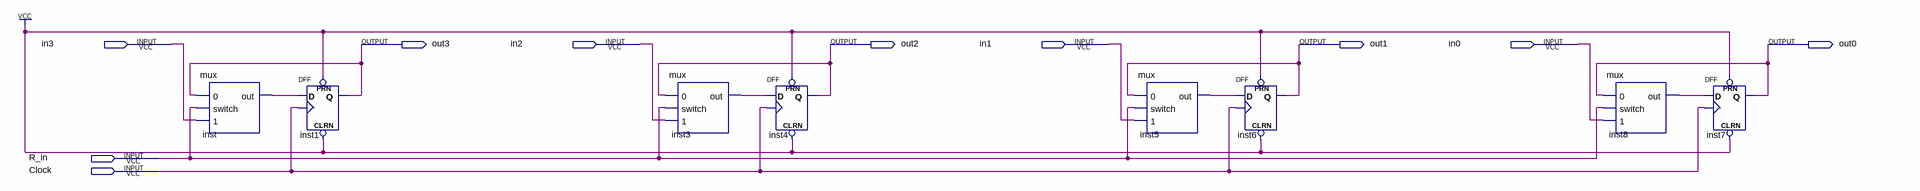
[diagram p0: schematic sheet]
// Quartus schematic register.bdf as structural Verilog: 8 symbols, 10 pins
module register (
  input  in3,
  input  in2,
  input  in1,
  input  in0,
  input  R_in,
  input  Clock,
  output out3,
  output out2,
  output out1,
  output out0
);

  wire inst3_out, inst5_out, inst8_out, inst_out;

  mux inst (.\0 (out3), .switch(R_in), .\1 (in3), .out(inst_out));
  DFF inst1 (.CLRN(1'b1), .CLK(Clock), .D(inst_out), .PRN(1'b1), .Q(out3));
  mux inst3 (.\0 (out2), .switch(R_in), .\1 (in2), .out(inst3_out));
  DFF inst4 (.CLRN(1'b1), .CLK(Clock), .D(inst3_out), .PRN(1'b1), .Q(out2));
  mux inst5 (.\0 (out1), .switch(R_in), .\1 (in1), .out(inst5_out));
  DFF inst6 (.CLRN(1'b1), .CLK(Clock), .D(inst5_out), .PRN(1'b1), .Q(out1));
  mux inst8 (.\0 (out0), .switch(R_in), .\1 (in0), .out(inst8_out));
  DFF inst7 (.CLRN(1'b1), .CLK(Clock), .D(inst8_out), .PRN(1'b1), .Q(out0));
endmodule
